# Altium schematic sheet sampler.SchDoc
size A; SheetNumber: 1; SheetTotal: 1
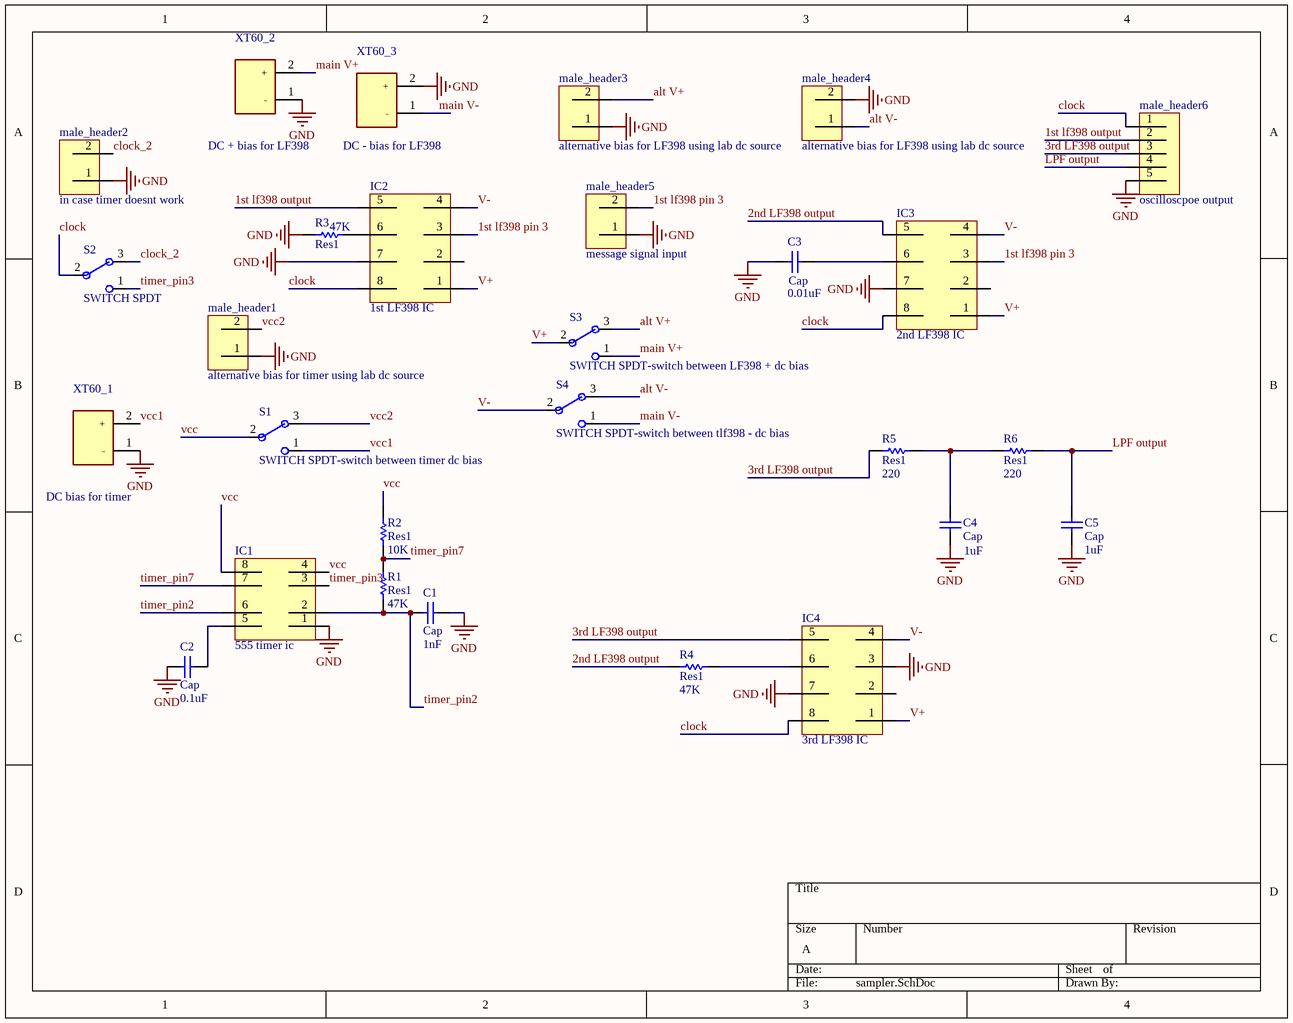
[diagram p0: sampler.SchDoc]

## Parts
C1  Cap  value 1nF  [RAD-0.3]
C2  Cap  value 0.1uF  [RAD-0.3]
C3  Cap  value 0.01uF  [RAD-0.3]
C4  Cap  value 1uF  [RAD-0.3]
C5  Cap  value 1uF  [RAD-0.3]
IC1  555 timer ic  [555timer_ic]
IC2  1st LF398 IC  [LF_398_IC]
IC3  2nd LF398 IC  [LF_398_IC]
IC4  3rd LF398 IC  [LF_398_IC]
male_header1  alternative bias for timer using lab dc source  [2pin_header]
male_header2  in case timer doesnt work  [2pin_header]
male_header3  alternative bias for LF398 using lab dc source  [2pin_header]
male_header4  alternative bias for LF398 using lab dc source  [2pin_header]
male_header5  message signal input  [2pin_header]
male_header6  oscilloscpoe output  [5pin_male_header]
R1  Res1  value 47K  [AXIAL-0.3]
R2  Res1  value 10K  [AXIAL-0.3]
R3  Res1  value 47K  [AXIAL-0.3]
R4  Res1  value 47K  [AXIAL-0.3]
R5  Res1  value 220  [AXIAL-0.3]
R6  Res1  value 220  [AXIAL-0.3]
S1  SWITCH SPDT-switch between timer dc bias  [EG1218]
S2  SWITCH SPDT  [EG1218]
S3  SWITCH SPDT-switch between LF398 + dc bias  [EG1218]
S4  SWITCH SPDT-switch between tlf398 - dc bias  [EG1218]
XT60_1  DC bias for timer  [XT60 FEMALE]
XT60_2  DC + bias for LF398  [XT60 FEMALE]
XT60_3  DC - bias for LF398  [XT60 FEMALE]

## Nets
GND: C1.2 C2.1 C3.1 C4.1 C5.1 IC1.1 IC2.7 IC3.7 IC4.3 IC4.7 male_header1.1 male_header2.1 male_header3.1 male_header4.2 male_header5.1 male_header6.5 R3.2 XT60_1.1(-) XT60_2.1(-) XT60_3.2(+)
1st lf398 output: IC2.5 male_header6.2
1st lf398 pin 3: IC2.3 IC3.3 male_header5.2
2nd LF398 output: IC3.5 R4.2
3rd LF398 output: IC4.5 male_header6.3 R5.1
alt V+: male_header3.2 S3.3
alt V-: male_header4.1 S4.3
clock: IC2.8 IC3.8 IC4.8 male_header6.1 S2.2
clock_2: male_header2.2 S2.3
LPF output: C5.2 male_header6.4 R6.2
main V+: S3.1 XT60_2.2(+)
main V-: S4.1 XT60_3.1(-)
timer_pin2: C1.1 IC1.2 IC1.6 R1.1
timer_pin3: IC1.3 S2.1
timer_pin7: IC1.7 R1.2 R2.1
V+: IC2.1 IC3.1 IC4.1 S3.2
V-: IC2.4 IC3.4 IC4.4 S4.2
vcc: IC1.4 IC1.8 R2.2 S1.2
vcc1: S1.1 XT60_1.2(+)
vcc2: male_header1.2 S1.3
NetC2_2: C2.2 IC1.5
NetC3_2: C3.2 IC3.6
NetC4_2: C4.2 R5.2 R6.1
NetIC2_6: IC2.6 R3.1
NetIC4_6: IC4.6 R4.1

Not connected (* = marked no-connect by the designer): IC2 2; IC3 2; IC4 2

## Library data of the parts
C1-C5 = Cap: Capacitor; Published: 8-Jun-2000; LatestRevisionDate: 17-Jul-2002; LatestRevisionNote: Re-released for DXP Platform.; PackageReference: RAD-0.3; Publisher: Altium Limited; PackageDescription: Radial Cap, Thru-Hole; 2 Leads; 0.3 in Pin Spacing
IC1 = Component_1: 555timer ic dip
IC2-IC4 = Component_1: LF398 IC
male_header1-male_header5 = Component_1: 2 pin header
male_header6 = Pin?: male header 5 pin
R1-R6 = Res1: Resistor; Published: 8-Jun-2000; LatestRevisionDate: 17-Jul-2002; LatestRevisionNote: Re-released for DXP Platform.; PackageReference: AXIAL-0.3; Publisher: Altium Limited; PackageDescription: Axial Device, Thru-Hole; 2 Leads; 0.3 in Pin Spacing
S1-S4 = SWITCH SPDT: EG1218 SWITCH SLIDE SPDT 200MA 30V
XT60_1-XT60_3 = XT60 FEMALE: CONNECTOR